# EasyEDA Pro project ProDoc_Integrated Board_2026-04-06.epro, schematic IC Board
Board Name: Integrated Board; Create Date: 2026-04-06; Page Name: P1; Project Name: Solenoid Board R&D; Schematic Name: IC Board; Update Date: 2026-04-06; Company: EasyEDA.com; Page Size: A4; Version: V1.0
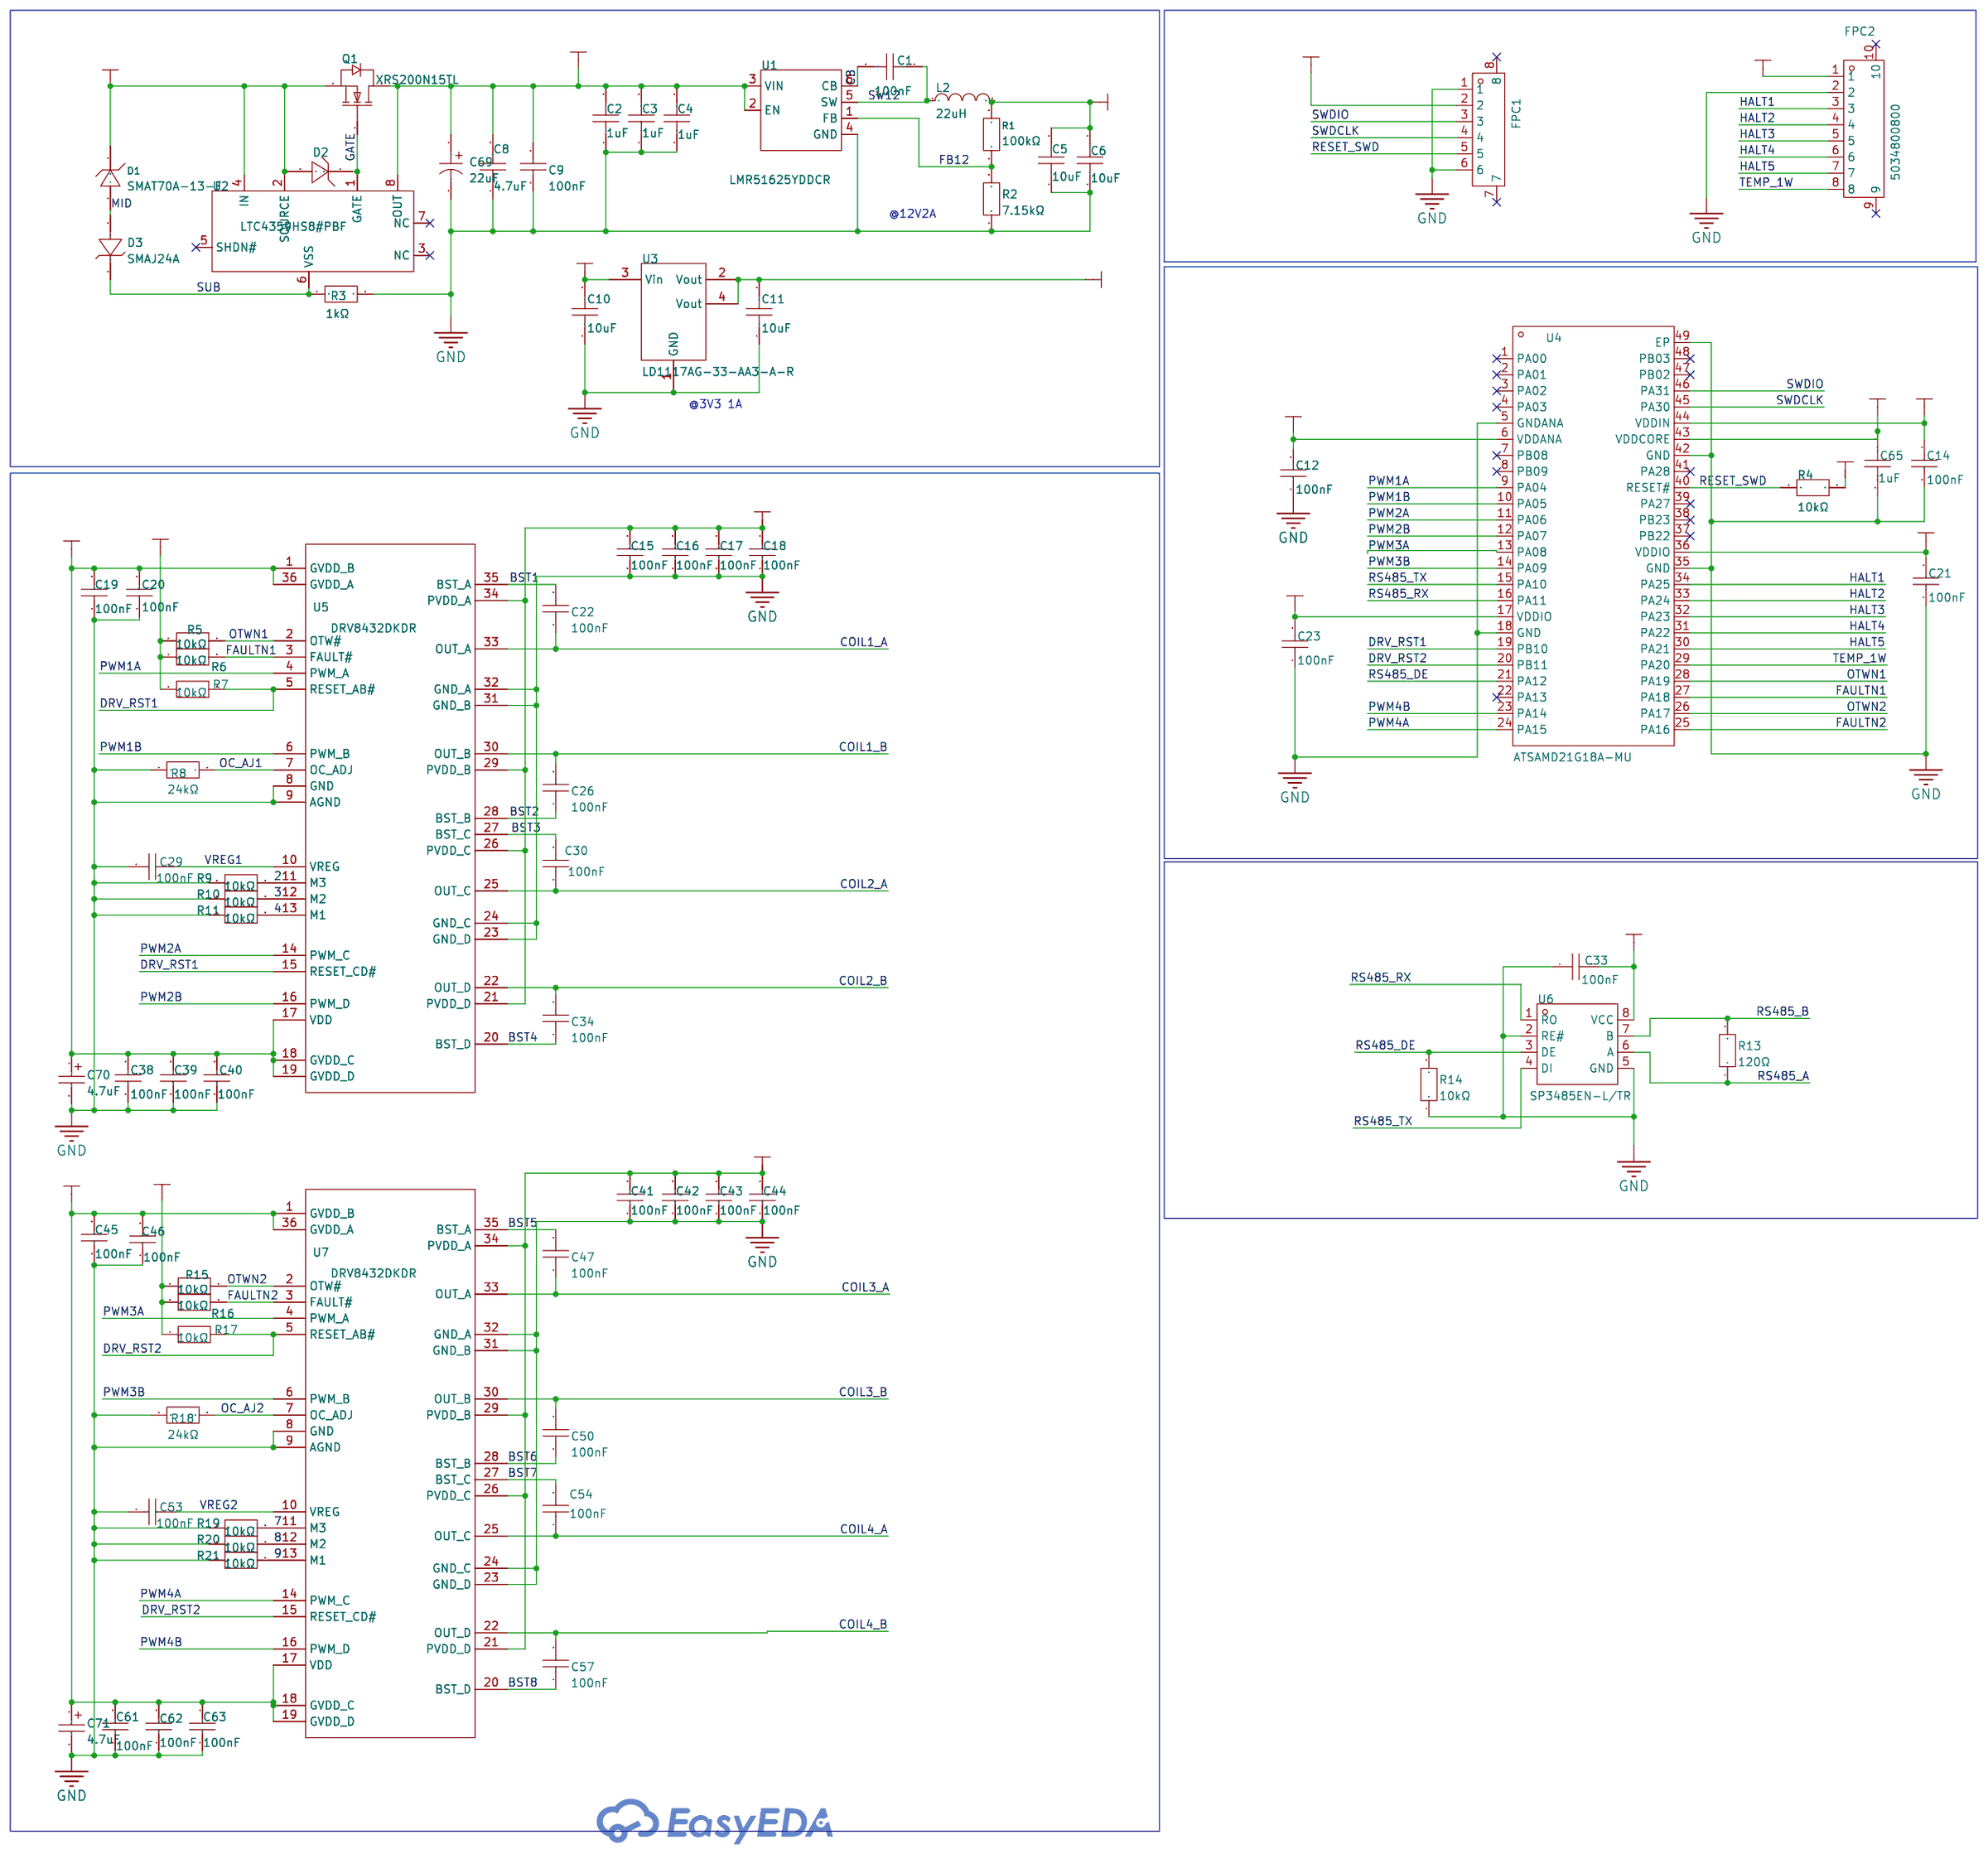
[diagram p0: schematic sheet]

## Parts
C1  100nF  [C0402]
C2  1uF  [C1206]
C3  1uF  [C1206]
C4  1uF  [C1206]
C5  10uF  [C1210]
C6  10uF  [C1210]
C8  4.7uF  [C1210]
C9  100nF  [C1206]
C10  10uF  [C0805]
C11  10uF  [C0805]
C12  100nF  [C0805]
C14  100nF  [C0805]
C15  100nF  [C0805]
C16  100nF  [C0805]
C17  100nF  [C0805]
C18  100nF  [C0805]
C19  100nF  [C0805]
C20  100nF  [C0805]
C21  100nF  [C0805]
C22  100nF  [C0805]
C23  100nF  [C0805]
C26  100nF  [C0805]
C29  100nF  [C0805]
C30  100nF  [C0805]
C33  100nF  [C0805]
C34  100nF  [C0805]
C38  100nF  [C0805]
C39  100nF  [C0805]
C40  100nF  [C0805]
C41  100nF  [C0805]
C42  100nF  [C0805]
C43  100nF  [C0805]
C44  100nF  [C0805]
C45  100nF  [C0805]
C46  100nF  [C0805]
C47  100nF  [C0805]
C50  100nF  [C0805]
C53  100nF  [C0805]
C54  100nF  [C0805]
C57  100nF  [C0805]
C61  100nF  [C0805]
C62  100nF  [C0805]
C63  100nF  [C0805]
C65  1uF  [C0805]
C69  22uF  [CAP-SMD_L7.3-W4.3-FD]
C70  4.7uF  [CASE-A_3216]
C71  4.7uF  [CASE-A_3216]
D1  SMAT70A-13-F  [SMA_L4.3-W2.6-LS5.2-RD]
D2  DDZ9699T-7  [SOD-523_L1.2-W0.8-LS1.6-RD]
D3  SMAJ24A  [SMA-SMD_L4.4-W2.7-LS5.4-RD]
FPC1  HC-FPC-05-09-6RLTAG  [FPC-SMD_6P-P0.50_HC-FPC-05-09-6RLTAG]
FPC2  5034800800  [FPC-SMD_5034800800]
L2  22uH  [IND-SMD_L13.5-W12.6]
Q1  XRS200N15TL  [TOLL-8_L10.4-W9.9-P1.20-LS11.7-BL_2]
R1  100kΩ  [R0805]
R2  7.15kΩ  [R0805]
R3  1kΩ  [R0805]
R4  10kΩ  [R0805]
R5  10kΩ  [R0805]
R6  10kΩ  [R0805]
R7  10kΩ  [R0805]
R8  24kΩ  [R0805]
R9  10kΩ  [R0805]
R10  10kΩ  [R0805]
R11  10kΩ  [R0805]
R13  120Ω  [R0805]
R14  10kΩ  [R0805]
R15  10kΩ  [R0805]
R16  10kΩ  [R0805]
R17  10kΩ  [R0805]
R18  24kΩ  [R0805]
R19  10kΩ  [R0805]
R20  10kΩ  [R0805]
R21  10kΩ  [R0805]
U1  LMR51625YDDCR  [SOT-23-6_L2.9-W1.6-P0.95-LS2.8-BL]
U2  LTC4359HS8#PBF  [SO-8_L4.9-W3.9-P1.27-LS6.0-BL]
U3  LD1117AG-33-AA3-A-R  [SOT-223-4_L6.5-W3.5-P2.30-LS7.0-BR]
U4  ATSAMD21G18A-MU  [QFN-48_L7.0-W7.0-P0.50-TL-EP5.1]
U5  DRV8432DKDR  [HSSOP-36_L16.0-W11.0-P0.65-LS14.2-BL]
U6  SP3485EN-L/TR  [SOIC-8_L5.0-W4.0-P1.27-LS6.0-BL]
U7  DRV8432DKDR  [HSSOP-36_L16.0-W11.0-P0.65-LS14.2-BL]

## Library data of the parts
C1 = GRM155R71C104KA88D: Capacitance:100nF Tolerance:±10% Tolerance:±10% Voltage Rating:16V Temperature Coefficient:X7R; LCSC Part Name: 100nF ±10% 16V; Supplier Part: C71629; Manufacturer: muRata(村田); Supplier Footprint: 0402; JLCPCB Part Class: Extended Part; Datasheet: https://item.szlcsc.com/datasheet/GRM155R71C104KA88D/72737.html; Supplier: LCSC; Tolerance: ±10%; Voltage Rating: 16V; Temperature Coefficient: X7R
C2-C4 = CGA5L2X7R2A105K160AA: Capacitance:1uF Tolerance:±10% Tolerance:±10% Voltage Rating:100V Temperature Coefficient:X7R; LCSC Part Name: 1uF ±10% 100V; Supplier Part: C2168321; Manufacturer: TDK; Supplier Footprint: 1206; JLCPCB Part Class: Extended Part; Datasheet: https://item.szlcsc.com/datasheet/CGA5L2X7R2A105K160AA/2260373.html; Supplier: LCSC; Tolerance: ±10%; Voltage Rating: 100V; Temperature Coefficient: X7R
C5 C6 = MSASU32MSB5106KPNA01: Capacitance:10uF Tolerance:±10% Tolerance:±10% Voltage Rating:50V Temperature Coefficient:X5R; LCSC Part Name: UMK325BJ106KM-P 10uF ±10% 50V; Supplier Part: C5677734; Manufacturer: TAIYO YUDEN(太诱); Supplier Footprint: 1210; JLCPCB Part Class: Extended Part; Datasheet: https://item.szlcsc.com/datasheet/MSASU32MSB5106KPNA01/6599058.html; Supplier: LCSC; Tolerance: ±10%; Voltage Rating: 50V; Temperature Coefficient: X5R
C8 = FS32X475K101EGG: Capacitance:4.7uF Tolerance:±10% Tolerance:±10% Voltage Rating:100V Temperature Coefficient:X7R; LCSC Part Name: 4.7uF ±10% 100V; Supplier Part: C381466; Manufacturer: PSA(信昌电陶); Supplier Footprint: 1210; JLCPCB Part Class: Extended Part; Datasheet: https://item.szlcsc.com/datasheet/FS32X475K101EGG/354087.html; Supplier: LCSC; Tolerance: ±10%; Voltage Rating: 100V; Temperature Coefficient: X7R
C9 = 1206B104K101NT: Capacitance:100nF Tolerance:±10% Tolerance:±10% Voltage Rating:100V Temperature Coefficient:X7R; LCSC Part Name: 100nF ±10% 100V; Supplier Part: C110255; Manufacturer: FH(风华); Supplier Footprint: 1206; JLCPCB Part Class: Extended Part; Datasheet: https://item.szlcsc.com/datasheet/1206B104K101NT/111477.html; Supplier: LCSC; Tolerance: ±10%; Voltage Rating: 100V; Temperature Coefficient: X7R
C10 C11 = CL21A106KBYQNNE: Capacitance:10uF Tolerance:±10% Tolerance:±10% Voltage Rating:50V Temperature Coefficient:X5R; LCSC Part Name: 10uF ±10% 50V; Supplier Part: C2932476; Manufacturer: SAMSUNG(三星); Supplier Footprint: 0805; JLCPCB Part Class: Extended Part; Datasheet: https://item.szlcsc.com/datasheet/CL21A106KBYQNNE/3277789.html; Supplier: LCSC; Tolerance: ±10%; Voltage Rating: 50V; Temperature Coefficient: X5R
C12 C14 C19-C21 C23 C29 C33 C38-C40 C45 C46 C53 C61-C63 = CL21B104KBCNNNC: Capacitance:100nF Tolerance:±10% Tolerance:±10% Voltage Rating:50V Temperature Coefficient:X7R; LCSC Part Name: 100nF ±10% 50V; Supplier Part: C1711; Manufacturer: SAMSUNG(三星); Supplier Footprint: 0805; JLCPCB Part Class: Extended Part; Datasheet: https://item.szlcsc.com/datasheet/CL21B104KBCNNNC/2063.html; Supplier: LCSC; Tolerance: ±10%; Voltage Rating: 50V; Temperature Coefficient: X7R
C15-C18 C22 C26 C30 C34 C41-C44 C47 C50 C54 C57 = C2012X7R2A104KT0L0U: Capacitance:100nF Tolerance:±10% Tolerance:±10% Voltage Rating:100V Temperature Coefficient:X7R; LCSC Part Name: 100nF ±10% 100V; Supplier Part: C76652; Manufacturer: TDK; Supplier Footprint: 0805; JLCPCB Part Class: Extended Part; Datasheet: https://item.szlcsc.com/datasheet/C2012X7R2A104KT0L0U/77779.html; Supplier: LCSC; Tolerance: ±10%; Voltage Rating: 100V; Temperature Coefficient: X7R
C65 = 0805B105K500NT_C215803: Capacitance:1uF Tolerance:±10% Tolerance:±10% Voltage Rating:50V Temperature Coefficient:X7R; LCSC Part Name: 1uF ±10% 50V; Supplier Part: C215803; Manufacturer: FH(风华); Manufacturer Part: 0805B105K500NT; Supplier Footprint: 0805; JLCPCB Part Class: Extended Part; Datasheet: https://item.szlcsc.com/datasheet/0805B105K500NT/216551.html; Supplier: LCSC; Tolerance: ±10%; Voltage Rating: 50V; Temperature Coefficient: X7R
C69 = T521X226M063ATE075: Capacitance:22uF Tolerance:±20% Tolerance:±20% Voltage Rating:63V Equivalent Series Resistance(ESR):75mΩ@100kHz Operating Temperature:-55℃~+125℃ Operating Temperature:-55℃~+125℃; LCSC Part Name: 22uF ±20% 63V; Supplier Part: C4984061; Manufacturer: KEMET(基美); Supplier Footprint: CASE-X-7343-43(mm); JLCPCB Part Class: Extended Part; Datasheet: https://item.szlcsc.com/datasheet/T521X226M063ATE075/5558930.html; Supplier: LCSC; Tolerance: ±20%; Voltage Rating: 63V; Equivalent Series Resistance(ESR): 75mΩ@100kHz; Operating Temperature: -55℃~+125℃
C70 C71 = TAJA475K016RNJ: Capacitance:4.7uF Tolerance:±10% Tolerance:±10% Voltage Rating:16V Equivalent Series Resistance(ESR):4Ω@100kHz Operating Temperature:-55℃~+125℃ Operating Temperature:-55℃~+125℃; LCSC Part Name: 4.7uF ±10% 16V; Supplier Part: C7187; Manufacturer: Kyocera AVX; Supplier Footprint: CASE-A-3216-18(mm); JLCPCB Part Class: Extended Part; Supplier: LCSC; Tolerance: ±10%; Voltage Rating: 16V; Equivalent Series Resistance(ESR): 4Ω@100kHz; Operating Temperature: -55℃~+125℃
D1 = SMAT70A-13-F: Reverse Stand-Off Voltage (Vrwm):70V Maximum Clamping Voltage:100V Peak Pulse Current (Ipp)@10/1000us:3.5A Peak Pulse Power Dissipation (Ppp)@10/1000us:400W Breakdown Voltage:77.8V Reverse Leakage Current (Ir):5uA Type:TVS; LCSC Part Name: 单向TVS 70V截止 3.5A峰值脉冲; Supplier Part: C135026; Manufacturer: DIODES(美台); Supplier Footprint: SMA(DO-214AC); JLCPCB Part Class: Extended Part; Datasheet: https://atta.szlcsc.com/upload/public/pdf/source/20180307/C135114_15204158133131410396.pdf; Supplier: LCSC; Reverse Stand-Off Voltage (Vrwm): 70V; Maximum Clamping Voltage: 100V; Peak Pulse Current (Ipp)@10/1000us: 3.5A; Peak Pulse Power Dissipation (Ppp)@10/1000us: 400W; Breakdown Voltage: 77.8V; Reverse Leakage Current (Ir): 5uA; Type: TVS
D2 = DDZ9699T-7: Diode Configuration:Independent Zener Voltage(Nom):12V Reverse Leakage Current (Ir):50nA@9.1V Zener Voltage(Range):11.4V~12.6V Zener Voltage(Range):11.4V~12.6V Pd - Power Dissipation:150mW Impedance(Zzt):- Operating Junction Temperature Range:-65℃~+150℃ O; LCSC Part Name: 独立式 耐压:12V 电流:50nA@9.1V; Supplier Part: C460861; Manufacturer: DIODES(美台); Supplier Footprint: SOD-523; JLCPCB Part Class: Extended Part; Datasheet: https://item.szlcsc.com/datasheet/DDZ9699T-7/465290.html; Supplier: LCSC; Diode Configuration: Independent; Zener Voltage(Nom): 12V; Reverse Leakage Current (Ir): 50nA@9.1V; Zener Voltage(Range): 11.4V~12.6V; Pd - Power Dissipation: 150mW; Operating Junction Temperature Range: -65℃~+150℃
D3 = SMAJ24A_C20883290: Polarity:Unidirectional Reverse Stand-Off Voltage (Vrwm):24V Clamping Voltage:38.9V Peak Pulse Current (Ipp):10.3A Voltage - Breakdown:29.5V Reverse Leakage Current (Ir):1uA Operating Temperature:-55℃~+150℃ Operating Temperature:-55℃~+150℃ Type:TVS; LCSC Part Name: 单向TVS 24V截止 峰值浪涌电流：10.3A; Supplier Part: C20883290; Manufacturer: OTW(联芯); Supplier Footprint: SMA(DO-214AC); JLCPCB Part Class: Extended Part; Datasheet: https://item.szlcsc.com/datasheet/SMAJ24A/22298750.html; Supplier: LCSC; Polarity: Unidirectional; Reverse Stand-Off Voltage (Vrwm): 24V; Clamping Voltage: 38.9V; Peak Pulse Current (Ipp): 10.3A; Voltage - Breakdown: 29.5V; Reverse Leakage Current (Ir): 1uA; Operating Temperature: -55℃~+150℃; Type: TVS
FPC1 = HC-FPC-05-09-6RLTAG: Locking Feature:Hinged Lid Contact Type:Double-Sided Contacts, Top and Bottom Entry Number of Contacts:6P Pitch:0.5mm Mounting Type:Surface Mount, Right Angle FFC, FCB Thickness:0.3mm FFC, FCB Thickness:0.3mm Height Above Board:1mm Contact Material:Copper; LCSC Part Name: 翻盖式 双侧触点/上下接 P数:6P 间距:0.5mm; Supplier Part: C5213748; Manufacturer: HCTL(华灿天禄); Supplier Footprint: SMD,P=0.5mm,卧贴; JLCPCB Part Class: Extended Part; Datasheet: https://item.szlcsc.com/datasheet/HC-FPC-05-09-6RLTAG/5909040.html; Supplier: LCSC; Locking Feature: Hinged Lid; Contact Type: Double-Sided Contacts, Top and Bottom Entry; Number of Contacts: 6P; Pitch: 0.5mm; Mounting Type: Surface Mount, Right Angle; FFC, FCB Thickness: 0.3mm; Height Above Board: 1mm; Contact Material: Copper Alloy; Operating Temperature: -55℃~+85℃
FPC2 = 5034800800: Locking Feature:Hinged Lid Contact Type:Double-Sided Contacts, Top and Bottom Entry Number of Contacts:8P Pitch:0.5mm Mounting Type:Surface Mount, Right Angle FFC, FCB Thickness:0.3mm FFC, FCB Thickness:0.3mm Height Above Board:1mm Contact Material:Phosph; LCSC Part Name: 翻盖式 双侧触点/上下接 P数:8P 间距:0.5mm; Supplier Part: C293338; Manufacturer: MOLEX; Supplier Footprint: SMD,P=0.5mm,卧贴; JLCPCB Part Class: Extended Part; Datasheet: https://www.molex.com/content/dam/molex/molex-dot-com/products/automated/en-us/salesdrawingpdf/503/503480/5034800800_sd.pdf?inline\; Supplier: LCSC; Locking Feature: Hinged Lid; Contact Type: Double-Sided Contacts, Top and Bottom Entry; Number of Contacts: 8P; Pitch: 0.5mm; Mounting Type: Surface Mount, Right Angle; FFC, FCB Thickness: 0.3mm; Height Above Board: 1mm; Contact Material: Phosphor Bronze; Contact Plating: Gold; Operating Temperature: -40℃~+105℃; Rated Voltage (Max): 50V; Current Rating (Max): 500mA
L2 = SLO1350S220MTT: Inductance:22uH Tolerance:±20% Tolerance:±20% Current Rating:4A DC Resistance(DCR):51mΩ; LCSC Part Name: 22uH ±20%; Supplier Part: C242225; Manufacturer: Sunltech(顺磁); Supplier Footprint: SMD; JLCPCB Part Class: Extended Part; Datasheet: https://item.szlcsc.com/datasheet/SLO1350S220MTT/241140.html; Supplier: LCSC; Tolerance: ±20%; Current Rating: 4A; DC Resistance(DCR): 51mΩ
Q1 = XRS200N15TL: Drain to Source Voltage:150V Current - Continuous Drain(Id):200A RDS(on):3.2mΩ@10V Pd - Power Dissipation:340W Gate Threshold Voltage (Vgs(th)):3V Gate Charge(Qg):19.9nC@10V Input Capacitance(Ciss):4.93nF Reverse Transfer Capacitance (Crss@Vds):21pF Opera; LCSC Part Name: N沟道150V快速开关MOSFET; Supplier Part: C50314149; Manufacturer: XNRUSEMI(新锐); Supplier Footprint: TOLL-8L; JLCPCB Part Class: Extended Part; Datasheet: https://item.szlcsc.com/datasheet/XRS200N15TL/52906592.html; Supplier: LCSC; Drain to Source Voltage: 150V; Current - Continuous Drain(Id): 200A; RDS(on): 3.2mΩ@10V; Pd - Power Dissipation: 340W; Gate Threshold Voltage (Vgs(th)): 3V; Gate Charge(Qg): 19.9nC@10V; Input Capacitance(Ciss): 4.93nF; Reverse Transfer Capacitance (Crss@Vds): 21pF; Operating Temperature: -55℃~+150℃; Output Capacitance(Coss): 722pF
R1 = FRC0805J104 TS: Type:Thick Film Resistor Resistance:100kΩ Tolerance:±5% Tolerance:±5% Power(Watts):125mW Voltage-Supply(Max):150V Temperature Coefficient:±100ppm/℃ Temperature Coefficient:±100ppm/℃ Operating Temperature:-55℃~+155℃ Operating Temperature:-55℃~+155℃; LCSC Part Name: 100kΩ ±5% 125mW 厚膜电阻; Supplier Part: C2907293; Manufacturer: FOJAN(富捷); Supplier Footprint: 0805; JLCPCB Part Class: Extended Part; Supplier: LCSC; Type: Thick Film Resistor; Tolerance: ±5%; Power(Watts): 125mW; Voltage-Supply(Max): 150V; Temperature Coefficient: ±100ppm/℃; Operating Temperature: -55℃~+155℃
R2 = FRC0805F7151TS: Type:Thick Film Resistor Resistance:7.15kΩ Tolerance:±1% Tolerance:±1% Power(Watts):125mW Voltage-Supply(Max):150V Temperature Coefficient:±100ppm/℃ Temperature Coefficient:±100ppm/℃ Operating Temperature:-55℃~+155℃ Operating Temperature:-55℃~+155℃; LCSC Part Name: 7.15kΩ ±1% 125mW 厚膜电阻; Supplier Part: C2933492; Manufacturer: FOJAN(富捷); Supplier Footprint: 0805; JLCPCB Part Class: Extended Part; Supplier: LCSC; Type: Thick Film Resistor; Tolerance: ±1%; Power(Watts): 125mW; Voltage-Supply(Max): 150V; Temperature Coefficient: ±100ppm/℃; Operating Temperature: -55℃~+155℃
R3 = FRC0805J102 TS: Type:Thick Film Resistor Resistance:1kΩ Tolerance:±5% Tolerance:±5% Power(Watts):125mW Voltage-Supply(Max):150V Temperature Coefficient:±100ppm/℃ Temperature Coefficient:±100ppm/℃ Operating Temperature:-55℃~+155℃ Operating Temperature:-55℃~+155℃; LCSC Part Name: 1kΩ ±5% 125mW 厚膜电阻; Supplier Part: C2907295; Manufacturer: FOJAN(富捷); Supplier Footprint: 0805; JLCPCB Part Class: Extended Part; Supplier: LCSC; Type: Thick Film Resistor; Tolerance: ±5%; Power(Watts): 125mW; Voltage-Supply(Max): 150V; Temperature Coefficient: ±100ppm/℃; Operating Temperature: -55℃~+155℃
R4-R7 R9-R11 R14-R17 R19-R21 = FRC0805J103TS: Type:Thick Film Resistor Resistance:10kΩ Tolerance:±5% Tolerance:±5% Power(Watts):125mW Voltage-Supply(Max):150V Temperature Coefficient:±100ppm/℃ Temperature Coefficient:±100ppm/℃ Operating Temperature:-55℃~+155℃ Operating Temperature:-55℃~+155℃; LCSC Part Name: 10kΩ ±5% 125mW 厚膜电阻; Supplier Part: C2930231; Manufacturer: FOJAN(富捷); Supplier Footprint: 0805; JLCPCB Part Class: Extended Part; Supplier: LCSC; Type: Thick Film Resistor; Tolerance: ±5%; Power(Watts): 125mW; Voltage-Supply(Max): 150V; Temperature Coefficient: ±100ppm/℃; Operating Temperature: -55℃~+155℃
R8 R18 = FRC0805F2402TS: Type:Thick Film Resistor Resistance:24kΩ Tolerance:±1% Tolerance:±1% Power(Watts):125mW Voltage-Supply(Max):150V Temperature Coefficient:±100ppm/℃ Temperature Coefficient:±100ppm/℃ Operating Temperature:-55℃~+155℃ Operating Temperature:-55℃~+155℃; LCSC Part Name: 24kΩ ±1% 125mW 厚膜电阻; Supplier Part: C2907246; Manufacturer: FOJAN(富捷); Supplier Footprint: 0805; JLCPCB Part Class: Extended Part; Datasheet: https://item.szlcsc.com/datasheet/FRC0805F2402TS/3180759.html; Supplier: LCSC; Type: Thick Film Resistor; Tolerance: ±1%; Power(Watts): 125mW; Voltage-Supply(Max): 150V; Temperature Coefficient: ±100ppm/℃; Operating Temperature: -55℃~+155℃
R13 = FRC0805J121 TS: Type:Thick Film Resistor Resistance:120Ω Tolerance:±5% Tolerance:±5% Power(Watts):125mW Voltage-Supply(Max):150V Temperature Coefficient:±100ppm/℃ Temperature Coefficient:±100ppm/℃ Operating Temperature:-55℃~+155℃ Operating Temperature:-55℃~+155℃; LCSC Part Name: 120Ω ±5% 125mW 厚膜电阻; Supplier Part: C3013232; Manufacturer: FOJAN(富捷); Supplier Footprint: 0805; JLCPCB Part Class: Extended Part; Supplier: LCSC; Type: Thick Film Resistor; Tolerance: ±5%; Power(Watts): 125mW; Voltage-Supply(Max): 150V; Temperature Coefficient: ±100ppm/℃; Operating Temperature: -55℃~+155℃
U1 = LMR51625YDDCR: Function:Buck Voltage - Supply:4.3V~60V Voltage - Supply:4.3V~60V Output Voltage:800mV~30V Output Voltage:800mV~30V Output Current:2.5A Frequency - Switching:1.1MHz Frequency - Switching:1.1MHz Operating Temperature:-40℃~+150℃@(TJ) Operating Temperature:-; LCSC Part Name: 降压型 2.5A 4.3V~60V; Supplier Part: C44991044; Manufacturer: TI(德州仪器); Supplier Footprint: SOT-23-6; JLCPCB Part Class: Extended Part; Datasheet: https://www.ti.com.cn/cn/lit/ds/symlink/lmr51625.pdf; Supplier: LCSC; Function: Buck; Voltage - Supply: 4.3V~60V; Output Voltage: 800mV~30V; Output Current: 2.5A; Frequency - Switching: 1.1MHz; Operating Temperature: -40℃~+150℃@(TJ); Synchronous Rectifier: Yes; Topology: Buck; Quiescent Current: 29uA; Switch tube (built-in/external): Built-in; Output Type: Adjustable
U2 = LTC4359HS8#PBF: Type:Ideal Diode Number of Channels:1 Control Input Logic:Active High Maximum Continuous Current:220uA Voltage - Supply:4V~80V Voltage - Supply:4V~80V Operating Temperature	-:-40℃~+125℃ Operating Temperature	-:-40℃~+125℃; LCSC Part Name: 理想二极管控制器，具备反向输入保护功能; Supplier Part: C1523986; Manufacturer: ADI(亚德诺); Supplier Footprint: SO-8; JLCPCB Part Class: Extended Part; Datasheet: https://item.szlcsc.com/datasheet/LTC4359HS8%2523PBF/1614784.html; Supplier: LCSC; Type: Ideal Diode; Number of Channels: 1; Control Input Logic: Active High; Maximum Continuous Current: 220uA; Voltage - Supply: 4V~80V; Operating Temperature	-: -40℃~+125℃
U3 = LD1117AG-33-AA3-A-R_C71121: Output Type:Fixed Voltage - Supply:15V Output Voltage:3.3V Output Voltage:3.3V Output Current:1A Power Supply Rejection Ratio (PSRR):75dB@(120Hz) Voltage Dropout:1.3V@(1A) standby current:5mA Noise:100uV Features:Over Temperature Protection；Over Current P; LCSC Part Name: 输入15V 输出3.3V 1A; Supplier Part: C71121; Manufacturer: UTC(友顺); Supplier Footprint: SOT-223-4; JLCPCB Part Class: Extended Part; Datasheet: https://item.szlcsc.com/datasheet/LD1117AG-33-AA3-A-R/72220.html; Supplier: LCSC; Output Type: Fixed; Voltage - Supply: 15V; Output Voltage: 3.3V; Output Current: 1A; Power Supply Rejection Ratio (PSRR): 75dB@(120Hz); Voltage Dropout: 1.3V@(1A); standby current: 5mA; Noise: 100uV; Features: Over Temperature Protection；Over Current Protection; Operating Temperature: -20℃~+125℃@(Tj); Output Configuration: Positive; Number of Outputs: 1
U4 = ATSAMD21G18A-MU: CPU Core:ARM Cortex-M Series CPU Maximum Speed:48MHz Program Storage Size:256KB Program Memory Type:FLASH Number of I/O:38 ADC (Bit):12bit DAC (Bit):10bit Voltage - Supply:1.62V~3.6V Voltage - Supply:1.62V~3.6V Applications:-; LCSC Part Name: 低功耗、带先进模拟电路和PWM的32位Cortex-M0+微控制器; Supplier Part: C966903; Manufacturer: MICROCHIP(美国微芯); Supplier Footprint: QFN-48-EP(7x7); JLCPCB Part Class: Extended Part; Datasheet: https://item.szlcsc.com/datasheet/ATSAMD21G18A-MU/1052846.html; Supplier: LCSC; CPU Core: ARM Cortex-M Series; CPU Maximum Speed: 48MHz; Program Storage Size: 256KB; Program Memory Type: FLASH; Number of I/O: 38; ADC (Bit): 12bit; DAC (Bit): 10bit; Voltage - Supply: 1.62V~3.6V
U5 U7 = DRV8432DKDR: Control Voltage:10.8V~13.2V Control Voltage:10.8V~13.2V Motor Drive Voltage(Vm):0V~52.5V Motor Drive Voltage(Vm):0V~52.5V RDS(on):220mΩ Operating Temperature:-40℃~+85℃ Operating Temperature:-40℃~+85℃; LCSC Part Name: 停产 13.2V电机驱动芯片; Supplier Part: C79853; Manufacturer: TI(德州仪器); Supplier Footprint: HSSOP-36; JLCPCB Part Class: Extended Part; Datasheet: https://www.ti.com/cn/lit/gpn/drv8432; Supplier: LCSC; Control Voltage: 10.8V~13.2V; Motor Drive Voltage(Vm): 0V~52.5V; RDS(on): 220mΩ; Operating Temperature: -40℃~+85℃
U6 = SP3485EN-L/TR: Type:Transceiver Number of Drivers:1 Number of Receivers:1 Voltage - Supply:3.3V Voltage - Supply:3.3V Data Rate:10Mbps Data Rate:10Mbps Number of Nodes:32 Operating Temperature:-40℃~+85℃ Operating Temperature:-40℃~+85℃ Supply Current (Iq):2mA Communicati; LCSC Part Name: SP3485 +3.3V低功耗半双工RS-485收发器，数据速率10Mbps; Supplier Part: C8963; Manufacturer: MaxLinear(迈凌); Supplier Footprint: SOIC-8; JLCPCB Part Class: Basic Part; Datasheet: https://item.szlcsc.com/datasheet/SP3485EN-L%252FTR/9482.html; Supplier: LCSC; Type: Transceiver; Number of Drivers: 1; Number of Receivers: 1; Voltage - Supply: 3.3V; Data Rate: 10Mbps; Number of Nodes: 32; Operating Temperature: -40℃~+85℃; Supply Current (Iq): 2mA; Communication Mode: Half-Duplex

## Nets
+3V3B: C11.2 C12.2 C14.2 C21.2 C23.2 C33.2 FPC1.2 FPC2.1 R4.2 R5.1 R6.1 R7.1 R15.1 R16.1 R17.1 U3.2(Vout) U3.4(Vout) U4.6(VDDANA) U4.17(VDDIO) U4.36(VDDIO) U4.44(VDDIN) U6.8(VCC)
+12VB: C5.2 C6.2 C10.2 C19.2 C20.2 C38.2 C39.2 C40.2 C45.2 C46.2 C61.2 C62.2 C63.2 C70.1 C71.1 L2.2 R1.2 U3.3(Vin) U5.1(GVDD_B) U5.17(VDD) U5.18(GVDD_C) U5.19(GVDD_D) U5.36(GVDD_A) U7.1(GVDD_B) U7.17(VDD) U7.18(GVDD_C) U7.19(GVDD_D) U7.36(GVDD_A)
+52V: D1.1(C) D2.2(A) Q1.2(S) U2.2(SOURCE) U2.4(IN)
+52VB: C2.2 C3.2 C4.2 C8.2 C9.2 C15.2 C16.2 C17.2 C18.2 C41.2 C42.2 C43.2 C44.2 C69.1 Q1.3(D) U1.2(EN) U1.3(VIN) U2.8(OUT) U5.21(PVDD_D) U5.26(PVDD_C) U5.29(PVDD_B) U5.34(PVDD_A) U7.21(PVDD_D) U7.26(PVDD_C) U7.29(PVDD_B) U7.34(PVDD_A)
GND: C2.1 C3.1 C4.1 C5.1 C6.1 C8.1 C9.1 C10.1 C11.1 C12.1 C14.1 C15.1 C16.1 C17.1 C18.1 C19.1 C20.1 C21.1 C23.1 C29.2 C33.1 C38.1 C39.1 C40.1 C41.1 C42.1 C43.1 C44.1 C45.1 C46.1 C53.2 C61.1 C62.1 C63.1 C65.1 C69.2 C70.2 C71.2 FPC1.1 FPC1.6 FPC2.2 R2.1 R3.2 R8.1 R9.1 R10.1 R11.1 R14.1 R18.1 R19.1 R20.1 R21.1 U1.4(GND) U3.1(GND) U4.5(GNDANA) U4.18(GND) U4.35(GND) U4.42(GND) U4.49(EP) U5.8(GND) U5.9(AGND) U5.23(GND_D) U5.24(GND_C) U5.31(GND_B) U5.32(GND_A) U6.2(RE#) U6.5(GND) U7.8(GND) U7.9(AGND) U7.23(GND_D) U7.24(GND_C) U7.31(GND_B) U7.32(GND_A)
2: R9.2 U5.11(M3)
3: R10.2 U5.12(M2)
4: R11.2 U5.13(M1)
7: R19.2 U7.11(M3)
8: R20.2 U7.12(M2)
9: R21.2 U7.13(M1)
BST1: C22.2 U5.35(BST_A)
BST2: C26.1 U5.28(BST_B)
BST3: C30.2 U5.27(BST_C)
BST4: C34.1 U5.20(BST_D)
BST5: C47.2 U7.35(BST_A)
BST6: C50.1 U7.28(BST_B)
BST7: C54.2 U7.27(BST_C)
BST8: C57.1 U7.20(BST_D)
CB: C1.1 U1.6(CB)
COIL1_A: C22.1 U5.33(OUT_A)
COIL1_B: C26.2 U5.30(OUT_B)
COIL2_A: C30.1 U5.25(OUT_C)
COIL2_B: C34.2 U5.22(OUT_D)
COIL3_A: C47.1 U7.33(OUT_A)
COIL3_B: C50.2 U7.30(OUT_B)
COIL4_A: C54.1 U7.25(OUT_C)
COIL4_B: C57.2 U7.22(OUT_D)
DRV_RST1: R7.2 U4.19(PB10) U5.5(RESET_AB#) U5.15(RESET_CD#)
DRV_RST2: R17.2 U4.20(PB11) U7.5(RESET_AB#) U7.15(RESET_CD#)
FAULTN1: R6.2 U4.27(PA18) U5.3(FAULT#)
FAULTN2: R16.2 U4.25(PA16) U7.3(FAULT#)
FB12: R1.1 R2.2 U1.1(FB)
GATE: D2.1(C) Q1.1(G) U2.1(GATE)
HALT1: FPC2.3 U4.34(PA25)
HALT2: FPC2.4 U4.33(PA24)
HALT3: FPC2.5 U4.32(PA23)
HALT4: FPC2.6 U4.31(PA22)
HALT5: FPC2.7 U4.30(PA21)
MID: D1.2(A) D3.2(A)
OC_AJ1: R8.2 U5.7(OC_ADJ)
OC_AJ2: R18.2 U7.7(OC_ADJ)
OTWN1: R5.2 U4.28(PA19) U5.2(OTW#)
OTWN2: R15.2 U4.26(PA17) U7.2(OTW#)
PWM1A: U4.9(PA04) U5.4(PWM_A)
PWM1B: U4.10(PA05) U5.6(PWM_B)
PWM2A: U4.11(PA06) U5.14(PWM_C)
PWM2B: U4.12(PA07) U5.16(PWM_D)
PWM3A: U4.13(PA08) U7.4(PWM_A)
PWM3B: U4.14(PA09) U7.6(PWM_B)
PWM4A: U4.24(PA15) U7.14(PWM_C)
PWM4B: U4.23(PA14) U7.16(PWM_D)
RESET_SWD: FPC1.5 R4.1 U4.40(RESET#)
RS485_A: R13.1 U6.6(A)
RS485_B: R13.2 U6.7(B)
RS485_DE: R14.2 U4.21(PA12) U6.3(DE)
RS485_RX: U4.16(PA11) U6.1(RO)
RS485_TX: U4.15(PA10) U6.4(DI)
SUB: D3.1(C) R3.1 U2.6(VSS)
SW12: C1.2 L2.1 U1.5(SW)
SWDCLK: FPC1.4 U4.45(PA30)
SWDIO: FPC1.3 U4.46(PA31)
TEMP_1W: FPC2.8 U4.29(PA20)
VCORE: C65.2 U4.43(VDDCORE)
VREG1: C29.1 U5.10(VREG)
VREG2: C53.1 U7.10(VREG)

Not connected (* = marked no-connect by the designer): FPC1 7* 8*; FPC2 9* 10*; U2 3(NC)* 5(SHDN#)* 7(NC)*; U4 1(PA00)* 2(PA01)* 3(PA02)* 4(PA03)* 7(PB08)* 8(PB09)* 22(PA13)* 37(PB22)* 38(PB23)* 39(PA27)* 41(PA28)* 47(PB02)* 48(PB03)*

## Notes on the sheet
- @12V2A
- @3V3 1A
